# Altium schematic sheet 18_Radar_service_USB_and_boot.SchDoc
size 289 x 396 mm
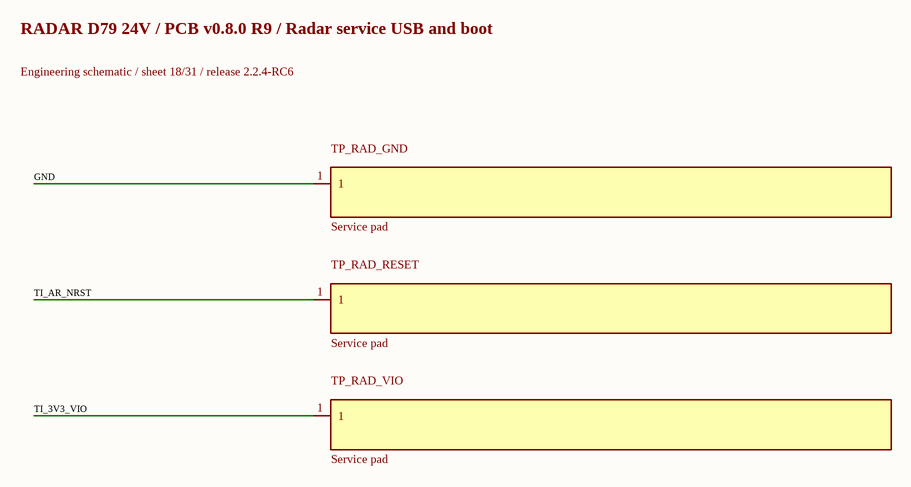
[diagram p0: 18_Radar_service_USB_and_boot.SchDoc]

## Parts
TP_RAD_GND  Service pad  [TestPoint_Pad_D1.5mm]
TP_RAD_RESET  Service pad  [TestPoint_Pad_D1.5mm]
TP_RAD_VIO  Service pad  [TestPoint_Pad_D1.5mm]

## Nets
GND: TP_RAD_GND.1
TI_3V3_VIO: TP_RAD_VIO.1
TI_AR_NRST: TP_RAD_RESET.1

## Notes on the sheet
- RADAR D79 24V / PCB v0.8.0 R9 / Radar service USB and boot
- Engineering schematic / sheet 18/31 / release 2.2.4-RC6